# Altium schematic sheet IMU to servo.schdoc
size 297 x 209 mm; Symbol: Drawing-Symbol_A4; Company: 嘉立创EDA; Version: V1.0; Page Size: A4; @Project Name: New Project_2026-09-05_10-48-28; @Update Date: 2026-09-05; @Create Date: 2026-09-05; Device: Drawing-Symbol_A4; @Board Name: Board1; @Page Name: P1; @Create Time: 10:48:45; @Page Count: 1; @Page No: 1; @Schematic Name: Schematic1; @Update Time: 10:48:45; @Assembly Variant: Basic; Border: 1; Title Block Position: 3; Size: A4; Width: 1170; Height: 825; Region Start: 1; X Region Count: 6; Y Region Count: 4; Blade Width: 10; SheetNumber: 1; SheetTotal: 1
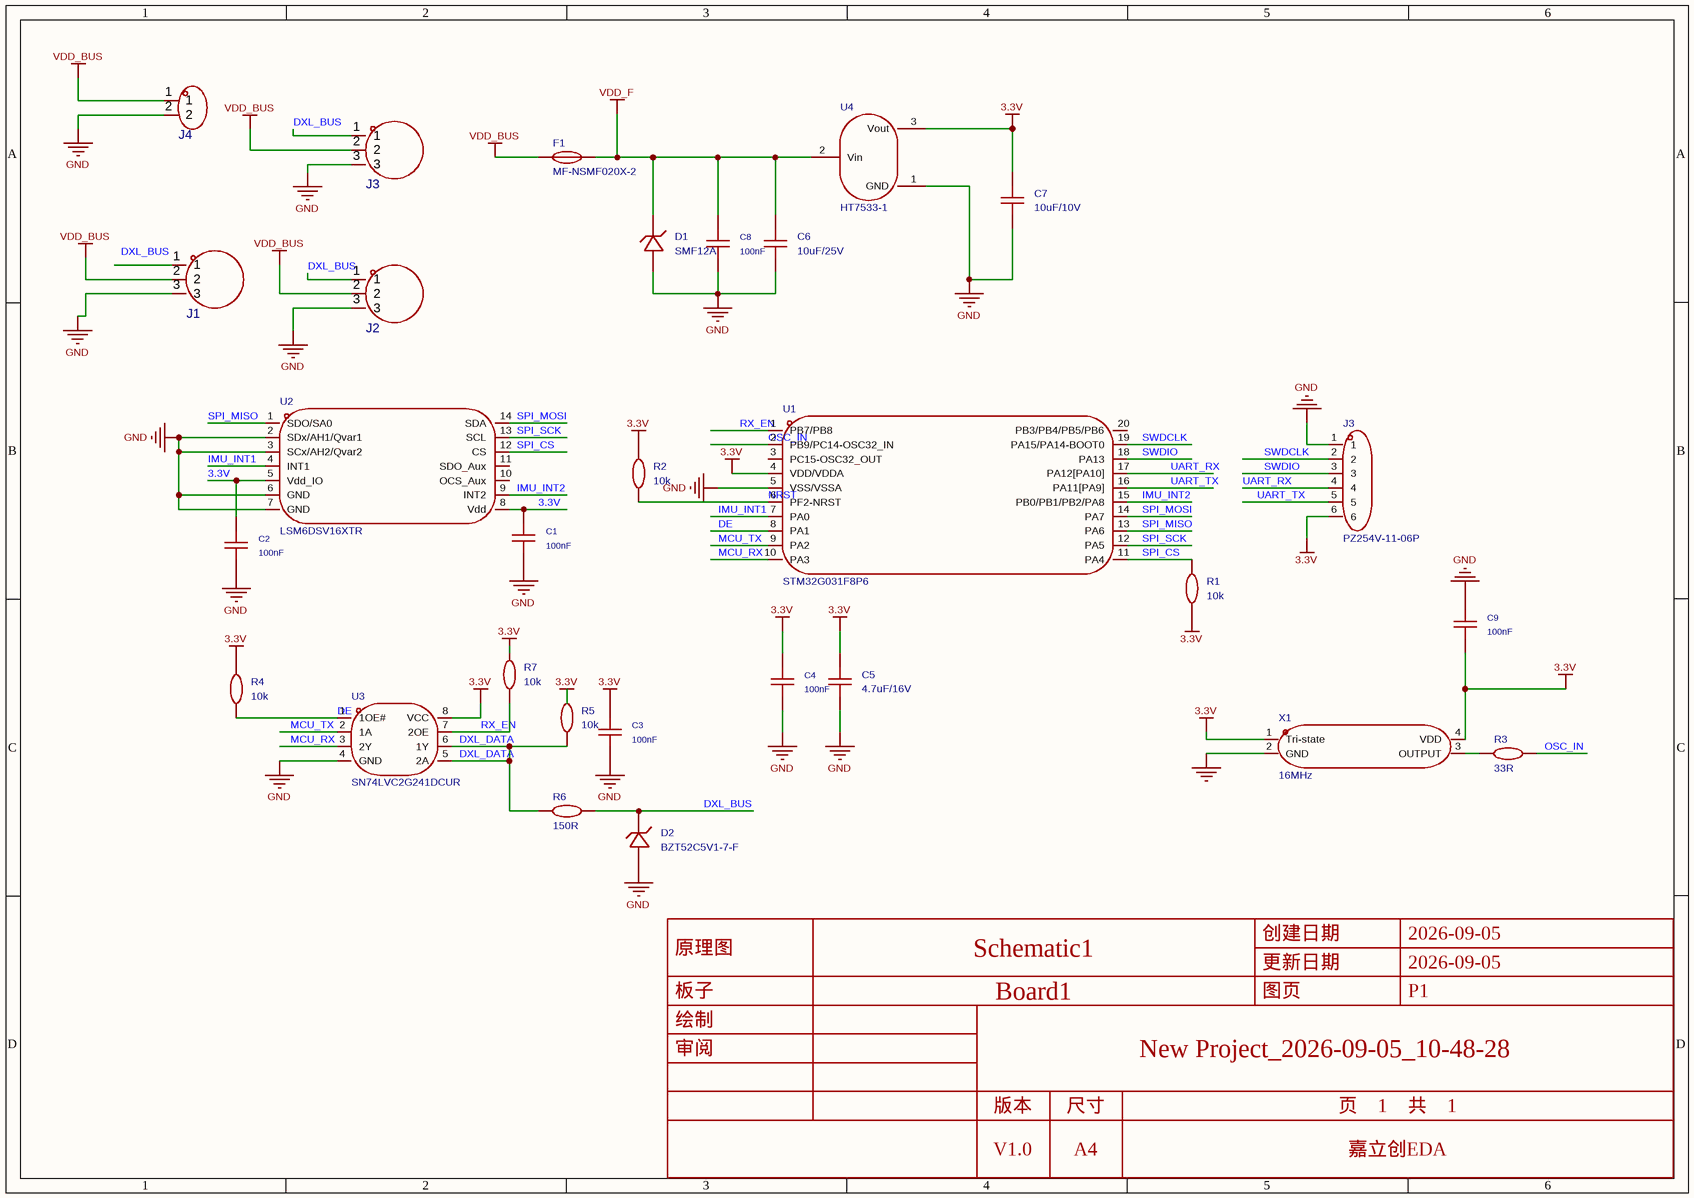
[diagram p0: IMU to servo.schdoc]

## Parts
(Parts that share a designator on the sheet are numbered #1, #2 ... from top to bottom, then left to right.)
C1  100nF  [C0603]
C2  100nF  [C0603]
C3  100nF  [C0603]
C4  100nF  [C0603]
C5  4.7uF/16V  [C0603]
C6  10uF/25V  [C0805]
C7  10uF/10V  [C0603]
C8  100nF  [C0603]
C9  100nF  [C0603]
D1  SMF12A  [SOD-123FL_L2.7-W1.8-LS3.7-RD]
D2  BZT52C5V1-7-F  [SOD-123_L2.7-W1.6-LS3.7-RD]
F1  MF-NSMF020X-2  [F1206]
J1  a2007wr-3p  [CONN-TH_A2007WR-3P]  (value not drawn)
J2  a2007wr-3p  [CONN-TH_A2007WR-3P]  (value not drawn)
J3#1  a2007wr-3p  [CONN-TH_A2007WR-3P]  (value not drawn)
J3#2  PZ254V-11-06P  [HDR-TH_6P-P2.54-V-M]
J4  xh-2pa  [CONN-TH_XH-2A]  (value not drawn)
R1  10k  [R0603]
R2  10k  [R0603]
R3  33R  [R0603]
R4  10k  [R0603]
R5  10k  [R0603]
R6  150R  [R0603]
R7  10k  [R0603]
U1  STM32G031F8P6  [TSSOP-20_L6.5-W4.4-P0.65-LS6.4-BL]
U2  LSM6DSV16XTR  [LGA-14_L3.0-W2.5-P0.50-BR]
U3  SN74LVC2G241DCUR  [VSSOP-8_L2.3-W2.0-P0.50-LS3.1-BR]
U4  HT7533-1  [SOT-89-3_L4.5-W2.5-P1.50-LS4.2-BR]
X1  16MHz  [OSC-SMD_4P-L3.2-W2.5-BL_SIT8008BI]

## Nets
3.3V: C1.2 C2.2 C3.1 C4.2 C5.2 C7.1 C9.1 J3#2.6 R1.2 R2.1 R4.1 R5.1 R7.2 U1.4(VDD/VDDA) U2.5(Vdd_IO) U2.8(Vdd) U3.8(VCC) U4.3(Vout) X1.1(Tri-state) X1.4(VDD)
GND: C1.1 C2.1 C3.2 C4.1 C5.1 C6.2 C7.2 C8.1 C9.2 D1.2(A) D2.2(A) J1.3 J2.3 J3#1.3 J3#2.1 J4.2 U1.5(VSS/VSSA) U2.2(SDx/AH1/Qvar1) U2.3(SCx/AH2/Qvar2) U2.6(GND) U2.7(GND) U3.4(GND) U4.1(GND) X1.2(GND)
VDD_BUS: F1.1 J1.2 J2.2 J3#1.2 J4.1
VDD_F: C6.1 C8.2 D1.1(C) F1.2 U4.2(Vin)
DE: R4.2 U1.8(PA1) U3.1(1OE#)
DXL_BUS: D2.1(C) J2.1 J3#1.1 R6.2
DXL_DATA: R5.2 R6.1 U3.5(2A) U3.6(1Y)
IMU_INT1: U1.7(PA0) U2.4(INT1)
IMU_INT2: U1.15(PB0/PB1/PB2/PA8) U2.9(INT2)
MCU_RX: U1.10(PA3) U3.3(2Y)
MCU_TX: U1.9(PA2) U3.2(1A)
NRST: R2.2 U1.6(PF2-NRST)
OSC_IN: R3.2 U1.2(PB9/PC14-OSC32_IN)
RX_EN: R7.1 U1.1(PB7/PB8) U3.7(2OE)
SPI_CS: R1.1 U1.11(PA4) U2.12(CS)
SPI_MISO: U1.13(PA6) U2.1(SDO/SA0)
SPI_MOSI: U1.14(PA7) U2.14(SDA)
SPI_SCK: U1.12(PA5) U2.13(SCL)
SWDCLK: J3#2.2 U1.19(PA15/PA14-BOOT0)
SWDIO: J3#2.3 U1.18(PA13)
UART_RX: J3#2.4 U1.17(PA12[PA10])
UART_TX: J3#2.5 U1.16(PA11[PA9])
NetR3_1: R3.1 X1.3(OUTPUT)

Not connected (* = marked no-connect by the designer): J1 1; U1 3(PC15-OSC32_OUT) 20(PB3/PB4/PB5/PB6); U2 10(OCS_Aux) 11(SDO_Aux)

## Notes on the sheet
- Labels drawn without touching a wire or pin: DXL_BUS
- 创建日期
- 2026-09-05
- 原理图
- 板子
- Schematic1
- Board1
- 更新日期
- 图页
- P1
- 绘制
- 审阅
- New Project_2026-09-05_10-48-28
- 版本
- V1.0
- 尺寸
- A4
- 页    1    共    1
- 嘉立创EDA

## Library data of the parts
C1-C4 C8 C9 = CC0603KRX7R9BB104: Manufacturer: YAGEO(国巨); Add into BOM: yes; ModelId: ac125912035d415993ca9572d50418b1聨0819f05c4eef4c71ace90d822a990e87; ModelName: C0603_L1.6-W0.8-H0.8; ModelTransform: 62.992,31.496,0,0,0,0,0,0,0; Symbol: CC0603KRX7R9BB104; Device: CC0603KRX7R9BB104; Convert to PCB: yes; Manufacturer Part: CC0603KRX7R9BB104; Supplier: LCSC; Supplier Part: C14663; Value: 100nF; FootprintName: C0603
C5 = CL10A475KO8NNNC: Manufacturer: SAMSUNG(三星); Add into BOM: yes; ModelId: ac125912035d415993ca9572d50418b1聨0819f05c4eef4c71ace90d822a990e87; ModelName: C0603_L1.6-W0.8-H0.8; ModelTransform: 62.992,31.496,0,0,0,0,0,0,0; Symbol: CL10A475KO8NNNC; Device: CL10A475KO8NNNC; Convert to PCB: yes; Manufacturer Part: CL10A475KO8NNNC; Supplier: LCSC; Supplier Part: C19666; Value: 4.7uF/16V; FootprintName: C0603
C6 = CL21A106KAYNNNE_C15850: Manufacturer: SAMSUNG(三星); Add into BOM: yes; ModelId: 1ba041120af144c991958decab20d241聨0819f05c4eef4c71ace90d822a990e87; ModelName: C0805_L2.0-W1.3-H1.3; ModelTransform: 78.74,51.181,0,0,0,0,0,0.0005,0; Symbol: CL21A106KAYNNNE; Device: CL21A106KAYNNNE_C15850; Convert to PCB: yes; Manufacturer Part: CL21A106KAYNNNE; Supplier: LCSC; Supplier Part: C15850; Value: 10uF/25V; FootprintName: C0805
C7 = CL10A106KP8NNNC: Manufacturer: SAMSUNG(三星); Add into BOM: yes; ModelId: ac125912035d415993ca9572d50418b1聨0819f05c4eef4c71ace90d822a990e87; ModelName: C0603_L1.6-W0.8-H0.8; ModelTransform: 62.992,31.496,0,0,0,0,0,0,0; Symbol: CL10A106KP8NNNC; Device: CL10A106KP8NNNC; Convert to PCB: yes; Manufacturer Part: CL10A106KP8NNNC; Supplier: LCSC; Supplier Part: C19702; Value: 10uF/10V; FootprintName: C0603
D1 = SMF12A_C2943870: Manufacturer: GOODWORK(固得沃克); Add into BOM: yes; ModelId: 86f9151e155e4fe2af0c4f2e0a80302e聨0819f05c4eef4c71ace90d822a990e87; ModelName: SOD-123FL_L2.8-W1.8-H1.1-LS3.6; ModelTransform: 141.732,70.866,0,180,0,0,0,0,0; Symbol: SMF12A_C2943870; Device: SMF12A_C2943870; Convert to PCB: yes; Manufacturer Part: SMF12A; Supplier: LCSC; Supplier Part: C2943870; FootprintName: SOD-123FL_L2.7-W1.8-LS3.7-RD
D2 = BZT52C5V1-7-F: Manufacturer: DIODES(美台); Add into BOM: yes; Value: 5V1; ModelId: ad7e39f9e5534b3c96ffdc5532ebb493聨0819f05c4eef4c71ace90d822a990e87; ModelName: SOD-123_L2.7-W1.6-H1.4-LS3.7; ModelTransform: 146.026,62.992,0,180,0,0,0.0005,0,0; Symbol: BZT52C5V1-7-F; Device: BZT52C5V1-7-F; Convert to PCB: yes; Manufacturer Part: BZT52C5V1-7-F; Supplier: LCSC; Supplier Part: C151588; FootprintName: SOD-123_L2.7-W1.6-LS3.7-RD
F1 = MF-NSMF020X-2: Manufacturer: BOURNS; Add into BOM: yes; ModelId: f1628daad26847a79b887277a2bc8541聨0819f05c4eef4c71ace90d822a990e87; ModelName: F1206_L3.2-W1.7-H0.6; ModelTransform: 125.984,66.929,0,0,0,0,0,0,0; Symbol: MF-NSMF020X-2; Device: MF-NSMF020X-2; Convert to PCB: yes; Manufacturer Part: MF-NSMF020X-2; Supplier: LCSC; Supplier Part: C210358; FootprintName: F1206
J1 J2 J3#1 = a2007wr-3p: 插针结构:1x3P;间距:2mm;安装方式:弯插;参考系列:-;总PIN数:3P;排数:1;每排PIN数:3;行距:-;额定电流:4A;触头材质:黄铜;触头镀层:锡;工作温度:-40℃~+105℃;; Manufacturer: CJT(长江连接器); AddInBom: yes; ModelId: 7576b685b3b842e1920e0f50f5ef1550; ModelTransform: 313.38914,346.456,0,0,0,0,11.811,105.708,-125.984; Pins Structure: 1x3P; Pitch: 2mm; Number of PINs Per Row: 3; Current Rating: 4A; Voltage Rating: 125V; Plastic Material: PA66; Flame Retardant Rating: UL94V-0; Z-Height of the Board: 4mm; X-Length of Bottom Edge on Board (Spacing Line): 7.96mm; Y-Width of Bottom Edge on Board: 8.8mm; Symbol: A2007WR-3P; LCSC Part Name: 1x3P 间距:2mm 弯插; SupplierPart: C225350; ManufacturerPart: A2007WR-3P; Supplier Footprint: 弯插,P=2mm; JLCPCB Part Class: Extended Part; Datasheet: https://item.szlcsc.com/datasheet/A2007WR-3P/225633.html; Supplier: LCSC; ConvertToPcb: yes; FootprintName: CONN-TH_A2007WR-3P; ModelName: CONN-TH_A2007WR-3P; Mounting Type: 弯插; Reference Series: -; Number of Pins: 3P; Number of Rows: 1; Row Spacing: -; Contact Material: 黄铜; Contact Plating: 锡; Operating Temperature: -40℃~+105℃; Color: 白色
J3#2 = PZ254V-11-06P: Manufacturer: XFCN(兴飞); Add into BOM: yes; ModelId: 66a147c6933d4029b68665bbcd1e2924聨0819f05c4eef4c71ace90d822a990e87; ModelName: HDR-TH_6P-P2.54-M-LI-1X6P; ModelTransform: 590.1563,98.425,0,0,0,0,0,0,-118.11; Symbol: PZ254V-11-06P; Device: PZ254V-11-06P; Convert to PCB: yes; Manufacturer Part: PZ254V-11-06P; Supplier: LCSC; Supplier Part: C492405; FootprintName: HDR-TH_6P-P2.54-V-M
J4 = xh-2pa: 插针结构:1x2P;间距:2.5mm;安装方式:直插;总PIN数:2P;排数:1;每排PIN数:2;额定电流:3A;工作温度:-25℃~+85℃;; Manufacturer: ZHOURI(洲日); AddInBom: yes; ModelId: 2cd591bdb98c4759a6cba2f4f7745e41; ModelName: XH2.5-2A; ModelTransform: 295.275,224.44837,0,180,0,0,0,18.819,-98.425; Pins Structure: 1x2P; Pitch: 2.5mm; Number of PINs Per Row: 2; Current Rating: 3A; Voltage Rating: 250V; Plastic Material: PA66; Z-Height of the Board: 7mm; X-Length of Bottom Edge on Board (Spacing Line): 7.5mm; Y-Width of Bottom Edge on Board: 5.7mm; Symbol: XH-2PA; LCSC Part Name: 1x2P 间距:2.5mm 直插; SupplierPart: C5258883; ManufacturerPart: XH-2PA; Supplier Footprint: 插件,P=2.5mm; JLCPCB Part Class: Extended Part; Datasheet: https://item.szlcsc.com/datasheet/XH-2PA/5978914.html; Supplier: LCSC; ConvertToPcb: yes; FootprintName: CONN-TH_XH-2A; Mounting Type: 直插; Number of Pins: 2P; Number of Rows: 1; Operating Temperature: -25℃~+85℃
R1 R2 R4 R5 = 0603WAF1002T5E: Manufacturer: UNI-ROYAL(厚声); Add into BOM: yes; ModelId: fc143cca1e79419f9cd78b61e9279f08聨0819f05c4eef4c71ace90d822a990e87; ModelTransform: 31.8897,63.7794,0,90,0,0,0,0,0; Symbol: 0603WAF1002T5E; Device: 0603WAF1002T5E; Convert to PCB: yes; Manufacturer Part: 0603WAF1002T5E; Supplier: LCSC; Supplier Part: C25804; Value: 10k; FootprintName: R0603; ModelName: R0603
R3 = 0603WAF330JT5E: Manufacturer: UNI-ROYAL(厚声); Add into BOM: yes; ModelId: fc143cca1e79419f9cd78b61e9279f08聨0819f05c4eef4c71ace90d822a990e87; ModelTransform: 31.8897,63.7794,0,90,0,0,0,0,0; Symbol: 0603WAF330JT5E; Device: 0603WAF330JT5E; Convert to PCB: yes; Manufacturer Part: 0603WAF330JT5E; Supplier: LCSC; Supplier Part: C23140; Value: 33R; FootprintName: R0603; ModelName: R0603
R6 = 0603WAF1500T5E: Manufacturer: UNI-ROYAL(厚声); Add into BOM: yes; ModelId: fc143cca1e79419f9cd78b61e9279f08聨0819f05c4eef4c71ace90d822a990e87; ModelTransform: 31.8897,63.7794,0,90,0,0,0,0,0; Symbol: 0603WAF1500T5E; Device: 0603WAF1500T5E; Convert to PCB: yes; Manufacturer Part: 0603WAF1500T5E; Supplier: LCSC; Supplier Part: C22808; Value: 150R; FootprintName: R0603; ModelName: R0603
R7 = 0603WAF1002T5E: Manufacturer: UNI-ROYAL(厚声); Add into BOM: yes; 3D Model: fc143cca1e79419f9cd78b61e9279f08聨0819f05c4eef4c71ace90d822a990e87; 3D Model Transform: 31.8897,63.7794,0,90,0,0,0,0,0; Symbol: 0603WAF1002T5E; Device: 0603WAF1002T5E; Convert to PCB: yes; Supplier Part: C25804; Manufacturer Part: 0603WAF1002T5E; Supplier: LCSC; Value: 10k; FootprintName: R0603; ModelName: R0603
U1 = STM32G031F8P6: Manufacturer: ST(意法半导体); Add into BOM: yes; ModelId: c491f68934b34c649df5890a1d97cd0f聨0819f05c4eef4c71ace90d822a990e87; ModelName: TSSOP-20_L6.5-W4.4-H1.0-LS6.4-P0.65; ModelTransform: 251.969,255.906,0,90,0,0,0.0005,0,0; Symbol: STM32G031F8P6; Device: STM32G031F8P6; Convert to PCB: yes; Manufacturer Part: STM32G031F8P6; Supplier: LCSC; Supplier Part: C529334; FootprintName: TSSOP-20_L6.5-W4.4-P0.65-LS6.4-BL
U2 = LSM6DSV16XTR: Manufacturer: ST(意法半导体); Add into BOM: yes; ModelId: 64f32784a16f466f897e9e56b6bbdf45聨0819f05c4eef4c71ace90d822a990e87; ModelTransform: 118.11,98.425,0,180,0,0,-0.001,0.004,0; Symbol: LSM6DSV16XTR; Device: LSM6DSV16XTR; Convert to PCB: yes; Manufacturer Part: LSM6DSV16XTR; Supplier: LCSC; Supplier Part: C5267406; FootprintName: LGA-14_L3.0-W2.5-P0.50-BR; ModelName: LGA-14_L3.0-W2.5-P0.50-BR
U3 = SN74LVC2G241DCUR: Manufacturer: TI(德州仪器); Add into BOM: yes; ModelId: c85411b4a3544d83a02d075c4dadd21f聨0819f05c4eef4c71ace90d822a990e87; ModelName: VSSOP-8_L2.3-W2.0-P0.50-LS3.1-BL; ModelTransform: 78.74,122.047,0,90,0,0,0,0,0; Symbol: SN74LVC2G241DCU; Device: SN74LVC2G241DCUR; Convert to PCB: yes; Manufacturer Part: SN74LVC2G241DCUR; Supplier: LCSC; Supplier Part: C10430; FootprintName: VSSOP-8_L2.3-W2.0-P0.50-LS3.1-BR
U4 = HT7533-1_C14289: Manufacturer: HOLTEK(合泰/盛群); Add into BOM: yes; ModelId: 6db690b7897d4d18a30d90c1b89525ee聨0819f05c4eef4c71ace90d822a990e87; ModelName: SOT-89-3_L4.3-W2.5-H1.6-LS4.1-P1.50; ModelTransform: 161.417,169.291,0,180,0,0,-18.661,0,0; Symbol: HT7533-1_C14289; Device: HT7533-1_C14289; Convert to PCB: yes; Manufacturer Part: HT7533-1; Supplier: LCSC; Supplier Part: C14289; FootprintName: SOT-89-3_L4.5-W2.5-P1.50-LS4.2-BR
X1 = S3D16.000000B20F30T: Manufacturer: SCTF(星通时频); Add into BOM: yes; ModelId: ae22b8d143894765bc8100c37cb6356f聨0819f05c4eef4c71ace90d822a990e87; ModelName: OSC-SMD_4P-L3.2-W2.5-H1.0; ModelTransform: 125.984,98.425,0,0,0,0,0,0,0; Symbol: S3D16.000000B20F30T; Device: S3D16.000000B20F30T; Convert to PCB: yes; Manufacturer Part: S3D16.000000B20F30T; Supplier: LCSC; Supplier Part: C387369; Value: 16MHz; FootprintName: OSC-SMD_4P-L3.2-W2.5-BL_SIT8008BI